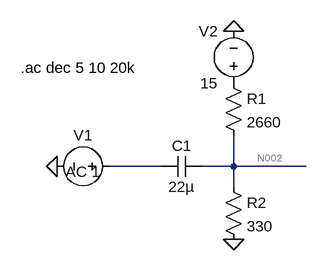
[diagram p0: schematic Draft1.asc]
Draft1.asc, the LTspice schematic file:
Version 4.1
SHEET 1 880 680
WIRE 96 176 16 176
WIRE 208 176 208 128
WIRE 208 176 160 176
WIRE 320 176 208 176
WIRE 208 208 208 176
FLAG 208 -32 0
FLAG -64 176 0
FLAG 208 288 0
SYMBOL voltage 208 64 R180
WINDOW 0 24 96 Left 2
WINDOW 3 24 16 Left 2
WINDOW 123 0 0 Left 0
WINDOW 39 0 0 Left 0
SYMATTR InstName V2
SYMATTR Value 15
SYMBOL cap 160 160 R90
WINDOW 0 0 32 VBottom 2
WINDOW 3 32 32 VTop 2
SYMATTR InstName C1
SYMATTR Value 22µ
SYMBOL res 192 32 R0
SYMATTR InstName R1
SYMATTR Value 2660
SYMBOL res 192 192 R0
SYMATTR InstName R2
SYMATTR Value 330
SYMBOL voltage 32 176 R90
WINDOW 0 -32 56 VBottom 2
WINDOW 3 -4 56 VBottom 2
WINDOW 123 24 56 VBottom 2
WINDOW 39 0 0 Left 0
SYMATTR InstName V1
SYMATTR Value ""
SYMATTR Value2 AC 1
TEXT -120 24 Left 2 !.ac dec 5 10 20k

The netlist it stands for:
* Draft1.asc
V2 P001 0 15
C1 N002 N001 22µ
R1 P001 N002 2660
R2 N002 0 330
V1 N001 0 AC 1
.ac dec 5 10 20k
.backanno
.end

* Results of the author's LTspice run, read from the files saved beside the schematic
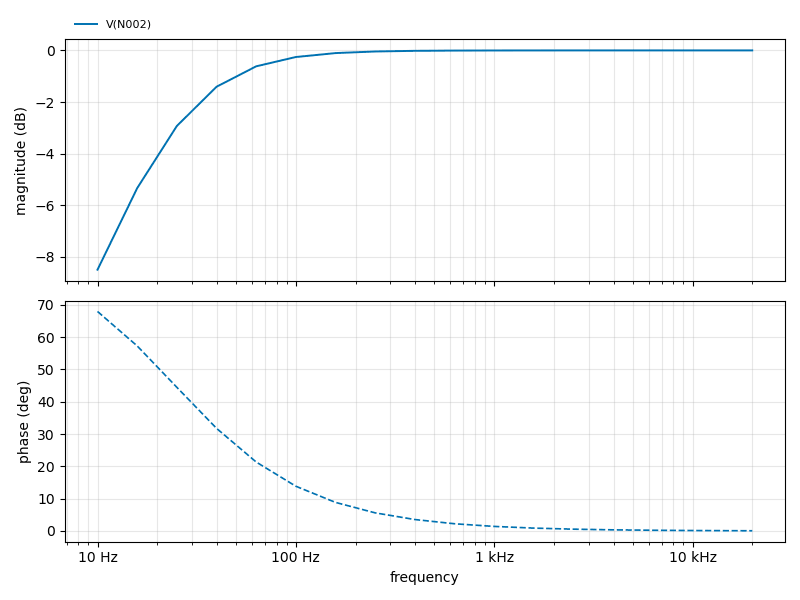
[diagram p1: AC Analysis of Draft1.asc, plotted from the saved traces]
* AC Analysis, 1 run:
*   V(N002): -8.50 dB at 10 Hz, -0.00 dB at 20 kHz, peak -0.00 dB at 20 kHz, 3 dB below the peak at 24.73 Hz